# EasyEDA Pro project esp-college-project_bkymsryt-aeef78a5.epro, board PCB-ShuttleBoard-BME690-V1_1
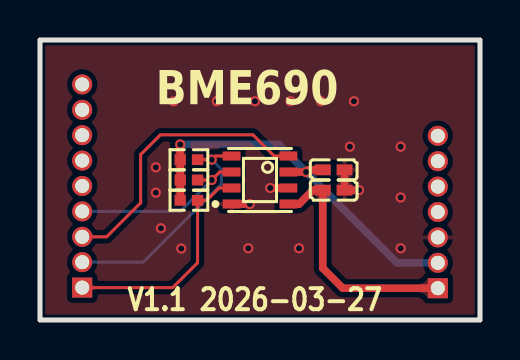
[diagram p9: board, top side]
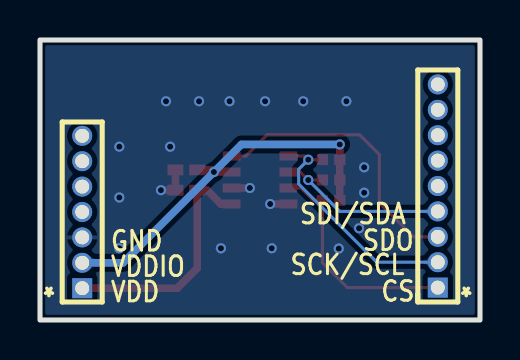
[diagram p10: board, bottom side, seen from below]

Outline 22 x 14 mm; copper layers: Top Layer, Bottom Layer. Coordinates in mm from the lower left corner of the outline.
Outline path: rectangle 22,0 0,14
Stack: Top Layer 0.035mm / Dielectric1 0.91mm FR4 er 4.5 / Bottom Layer 0.035mm

## Design rules (mm)
spacing copperThickness1oz (default): track to track 0.102, other pairs 0.152 to 0.3
spacing copperThickness2oz: track to track 0.203, other pairs 0.152 to 0.3
spacing Plane_innerPlane: track to track 0.102, other pairs 0.152 to 0.3
spacing Copper_copperRegion: track to track 0.102, other pairs 0.152 to 0.3
track width copperThickness1oz (default): min 0.127, default 0.152, max 2.54
track width copperThickness2oz: min 0.203, default 0.254, max 2.54
track width power: min 0.127, default 0.381, max 2.54
differential pair differentialPair (default): width min 0.127, default 0.254, max 2.54; gap min 0.152, default 0.152
net VDD uses power
net GND uses power
net VDDIO uses power
pour e60 uses Copper_copperRegion
pour e73 uses Copper_copperRegion

## Placement (name value [footprint] x y rotation side)
C1  100nF  [C0402]  14.68 6.49 180 top
C2  100nF  [C0402]  14.68 7.51 180 top
H1  ZX-PZ1.27-1-7PZZ  [HDR-TH_7P-P1.27-V-M-2]  19.89 5.4 90 bottom
H2  HX PZ1.27-1x9P ZZ  [HDR-TH_9P-P1.27-V-M]  2.11 6.7 90 bottom
R1  4.7kΩ(NC)  [R0402]  7.44 7 0 top
R2  4.7kΩ(NC)  [R0402]  7.44 8.02 0 top
R3  10kΩ  [R0402_1]  7.44 5.98 180 top
U1  BME690  [LGA-8_L3.0-W3.0-P0.80-TR-1]  11 7 180 top

## Footprints (pads in the part's own frame, mm; a bottom-side part is the same pattern mirrored in y, then rotated)
C0402
  rect 0.79x0.54 smd: 1(-0.545,0) 2(0.545,0)
HDR-TH_7P-P1.27-V-M-2
  rect 1x1 hole 0.7: 1(-3.81,0)
  round 1 hole 0.7: 2(-2.54,0) 3(-1.27,0) 4(0,0) 5(1.27,0) 6(2.54,0) 7(3.81,0)
HDR-TH_9P-P1.27-V-M
  rect 1x1 hole 0.7: 1(-5.08,0)
  round 1 hole 0.7: 2(-3.81,0) 3(-2.54,0) 4(-1.27,0) 5(0,0) 6(1.27,0) 7(2.54,0) 8(3.81,0) 9(5.08,0)
LGA-8_L3.0-W3.0-P0.80-TR-1
  rect 0.889x0.448 smd: 1(1.419,1.2) 2(1.419,0.4) 3(1.419,-0.4) 4(1.419,-1.2) 5(-1.419,-1.2) 6(-1.419,-0.4) 7(-1.419,0.4) 8(-1.419,1.2)
R0402
  rect 0.566x0.54 smd: 1(-0.433,0) 2(0.433,0)
R0402_1
  rect 0.566x0.54 smd: 1(-0.433,0) 2(0.433,0)

## Nets
As in the schematic.

Pads without a net: H1 4 5 6 7; H2 5 6 7 8 9

## Via types
v1: diameter 0.508, hole 0.305, Top Layer to Bottom Layer, 23 vias

## Routing (per net, layer and track width the routed paths; a pad name or vN(x,y) marks a point on that pad's centre or on a via; arc(x,y) is an arc through that point)
GND: length 3.6
  Top Layer w0.381: v1(15.95,6.49) C1.1 C2.1 ; U1.1 v1(10.49,5.8) ; U1.7 v1(11.51,6.6)
  vias: v1(5.79,7.64) v1(5.79,6.36) v1(6.05,4.59) v1(6.68,10.94) v1(7.06,3.57) v1(8.84,10.94) v1(10.41,3.59) v1(10.75,10.94) v1(12.52,10.94) v1(12.95,3.59) v1(14.05,10.94) v1(15.49,8.67) v1(15.7,10.94) v1(18.03,8.67) v1(18.03,6.13) v1(18.03,3.59)
VDD: length 12.1
  Top Layer w0.381: H1.1 15.14,1.59 14.14,2.59 C1.2 13.65,6.49 12.96,5.8 U1.8
VDDIO: length 19.9
  Top Layer w0.381: R3.2 R1.1 R2.1 v1(7.01,8.78) ; U1.6 v1(13.31,7.4) 13.41,7.51 C2.2
  Bottom Layer w0.381: v1(7.01,8.78) 11.93,8.78 v1(13.31,7.4) 17.84,2.86 H1.2
CS: length 11.4
  Top Layer w0.152: U1.2 8.95,6.6 8.33,5.98 R3.1 7.88,2.86 6.64,1.62 H2.1
SCK/SCL: length 11.8
  Top Layer w0.152: U1.4 8.77,8.2 v1(8.59,8.02) R2.2
  Bottom Layer w0.152: v1(8.59,8.02) 9.07,7.53 9.07,6.8 5.16,2.89 H2.2
SDI/SDA: length 9
  Top Layer w0.152: R1.2 v1(8.59,7) 8.99,7.4 U1.3
  Bottom Layer w0.152: H2.4 7.02,5.43 v1(8.59,7)
SDO: length 14.3
  Top Layer w0.152: H2.3 3.33,4.16 5.03,5.86 5.03,8.27 6.02,9.26 10.65,9.26 11.71,8.2 U1.5

## Copper pours and planes (outline as drawn; the poured copper is in the pictures)
GND on Top Layer: 0,14 22,14 22,0 0,0
GND on Bottom Layer: 0,14 22,14 22,0 0,0

Small or netless copper shapes (teardrops, artwork), in the pictures only: 36 on Top Layer, 7 on Bottom Layer

## Text on the board
Bottom Silkscreen Layer: * | CS | SDO | SDI/SDA | SCK/SCL | GND | VDDIO | VDD
Top Silkscreen Layer: V1.1 2026-03-27 | BME690
